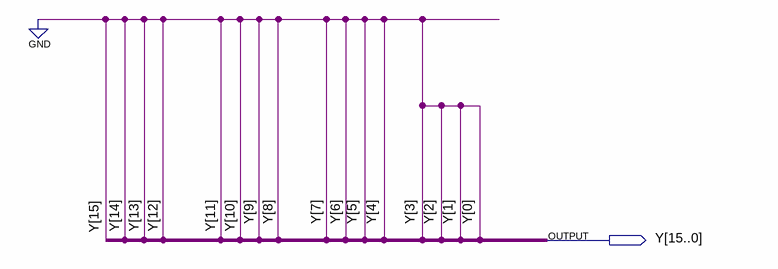
[diagram p0: schematic sheet]
// Quartus schematic Zero_Const.bdf as structural Verilog: 0 symbols, 1 pins
module Zero_Const (
  output [15:0] Y
);


  assign Y = {16{1'b0}};
endmodule
